# Altium schematic sheet 02_Control_and_Sensors.SchDoc: CONTROLLERS, STEERING AND ULTRASONIC SENSOR
size 406 x 279 mm; Revision: A - DRAFT; Date: 2026-11-18; SheetNumber: 2; SheetTotal: 3; Author: Sarbfateh Suppal; DocumentNumber: ROVER-A-2; ProjectName: Four-motor Rover Carrier
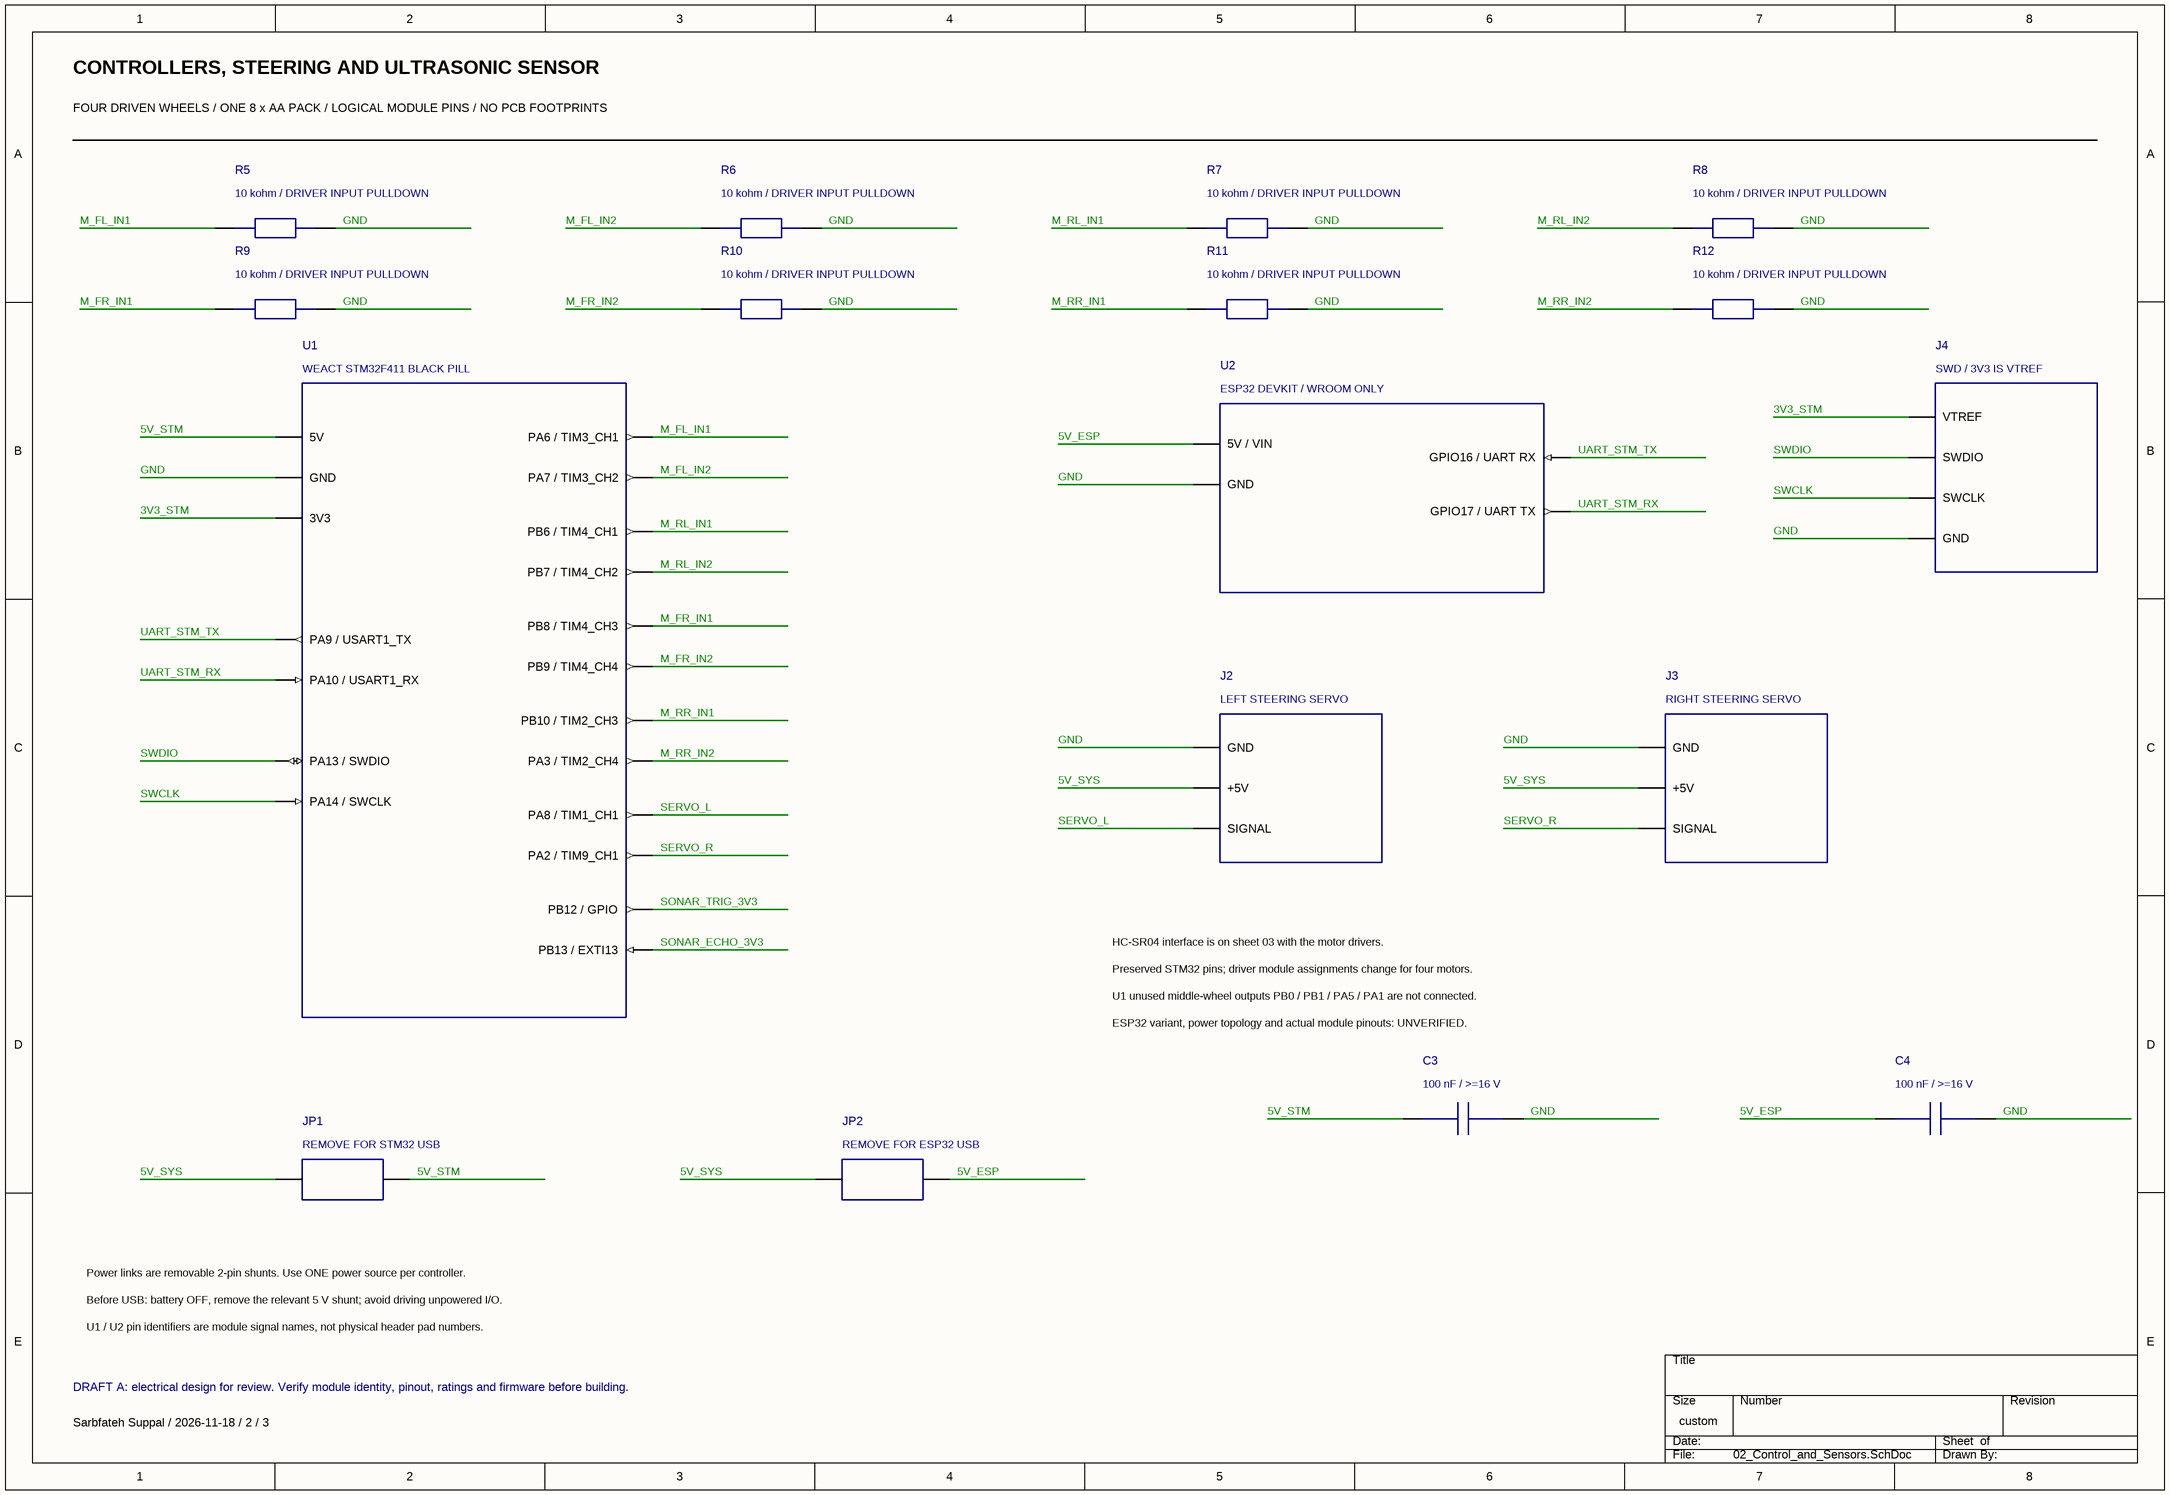
[diagram p0: 02_Control_and_Sensors.SchDoc]

## Parts
C3  100 nF / >=16 V
C4  100 nF / >=16 V
J2  LEFT STEERING SERVO
J3  RIGHT STEERING SERVO
J4  SWD / 3V3 IS VTREF
JP1  REMOVE FOR STM32 USB
JP2  REMOVE FOR ESP32 USB
R5  10 kohm / DRIVER INPUT PULLDOWN
R6  10 kohm / DRIVER INPUT PULLDOWN
R7  10 kohm / DRIVER INPUT PULLDOWN
R8  10 kohm / DRIVER INPUT PULLDOWN
R9  10 kohm / DRIVER INPUT PULLDOWN
R10  10 kohm / DRIVER INPUT PULLDOWN
R11  10 kohm / DRIVER INPUT PULLDOWN
R12  10 kohm / DRIVER INPUT PULLDOWN
U1  WEACT STM32F411 BLACK PILL
U2  ESP32 DEVKIT / WROOM ONLY

## Nets
3V3_STM: J4.1(VTREF) U1.3V3
5V_ESP: C4.1 JP2.2 U2.5V(5V_/_VIN)
5V_STM: C3.1 JP1.2 U1.5V
5V_SYS: J2.2(+5V) J3.2(+5V) JP1.1 JP2.1
GND: C3.2 C4.2 J2.1(GND) J3.1(GND) J4.4(GND) R5.2 R6.2 R7.2 R8.2 R9.2 R10.2 R11.2 R12.2 U1.GND U2.GND
M_FL_IN1: R5.1 U1.PA6(PA6_/_TIM3_CH1)
M_FL_IN2: R6.1 U1.PA7(PA7_/_TIM3_CH2)
M_FR_IN1: R9.1 U1.PB8(PB8_/_TIM4_CH3)
M_FR_IN2: R10.1 U1.PB9(PB9_/_TIM4_CH4)
M_RL_IN1: R7.1 U1.PB6(PB6_/_TIM4_CH1)
M_RL_IN2: R8.1 U1.PB7(PB7_/_TIM4_CH2)
M_RR_IN1: R11.1 U1.PB10(PB10_/_TIM2_CH3)
M_RR_IN2: R12.1 U1.PA3(PA3_/_TIM2_CH4)
SERVO_L: J2.3(SIGNAL) U1.PA8(PA8_/_TIM1_CH1)
SERVO_R: J3.3(SIGNAL) U1.PA2(PA2_/_TIM9_CH1)
SONAR_ECHO_3V3: U1.PB13(PB13_/_EXTI13)
SONAR_TRIG_3V3: U1.PB12(PB12_/_GPIO)
SWCLK: J4.3(SWCLK) U1.PA14(PA14_/_SWCLK)
SWDIO: J4.2(SWDIO) U1.PA13(PA13_/_SWDIO)
UART_STM_RX: U1.PA10(PA10_/_USART1_RX) U2.IO17(GPIO17_/_UART_TX)
UART_STM_TX: U1.PA9(PA9_/_USART1_TX) U2.IO16(GPIO16_/_UART_RX)

## Notes on the sheet
- CONTROLLERS, STEERING AND ULTRASONIC SENSOR
- FOUR DRIVEN WHEELS / ONE 8 x AA PACK / LOGICAL MODULE PINS / NO PCB FOOTPRINTS
- HC-SR04 interface is on sheet 03 with the motor drivers.
- Preserved STM32 pins; driver module assignments change for four motors.
- U1 unused middle-wheel outputs PB0 / PB1 / PA5 / PA1 are not connected.
- ESP32 variant, power topology and actual module pinouts: UNVERIFIED.
- Power links are removable 2-pin shunts. Use ONE power source per controller.
- Before USB: battery OFF, remove the relevant 5 V shunt; avoid driving unpowered I/O.
- U1 / U2 pin identifiers are module signal names, not physical header pad numbers.
- DRAFT A: electrical design for review. Verify module identity, pinout, ratings and firmware before building.
- Sarbfateh Suppal / 2026-11-18 / 2 / 3

## Library data of the parts
C3 = capacitor_C3
C4 = capacitor_C4
J2 = module_J2
J3 = module_J3
J4 = module_J4
JP1 = jumper_JP1
JP2 = jumper_JP2
R5 = resistor_R5
R6 = resistor_R6
R7 = resistor_R7
R8 = resistor_R8
R9 = resistor_R9
R10 = resistor_R10
R11 = resistor_R11
R12 = resistor_R12
U1 = module_U1
U2 = module_U2